# Altium schematic sheet Mechanical.SchDoc
size A; DocumentNumber: 14; SheetNumber: 14; SheetTotal: 14
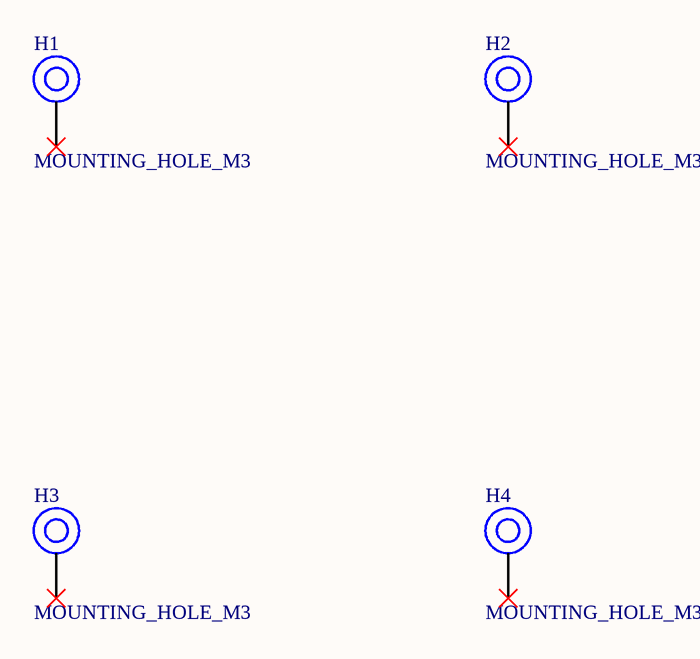
[diagram p0: Mechanical.SchDoc]

## Parts
H1  MOUNTING_HOLE_M3  [MOUNTING_HOLE_M3]  (no BOM)
H2  MOUNTING_HOLE_M3  [MOUNTING_HOLE_M3]  (no BOM)
H3  MOUNTING_HOLE_M3  [MOUNTING_HOLE_M3]  (no BOM)
H4  MOUNTING_HOLE_M3  [MOUNTING_HOLE_M3]  (no BOM)

## Nets

Not connected (* = marked no-connect by the designer): H1 1*; H2 1*; H3 1*; H4 1*

## Library data of the parts
H1-H4 = MOUNTING_HOLE: GENERIC MOUNTING HOLE